# Altium project Zooid.PrjPcb
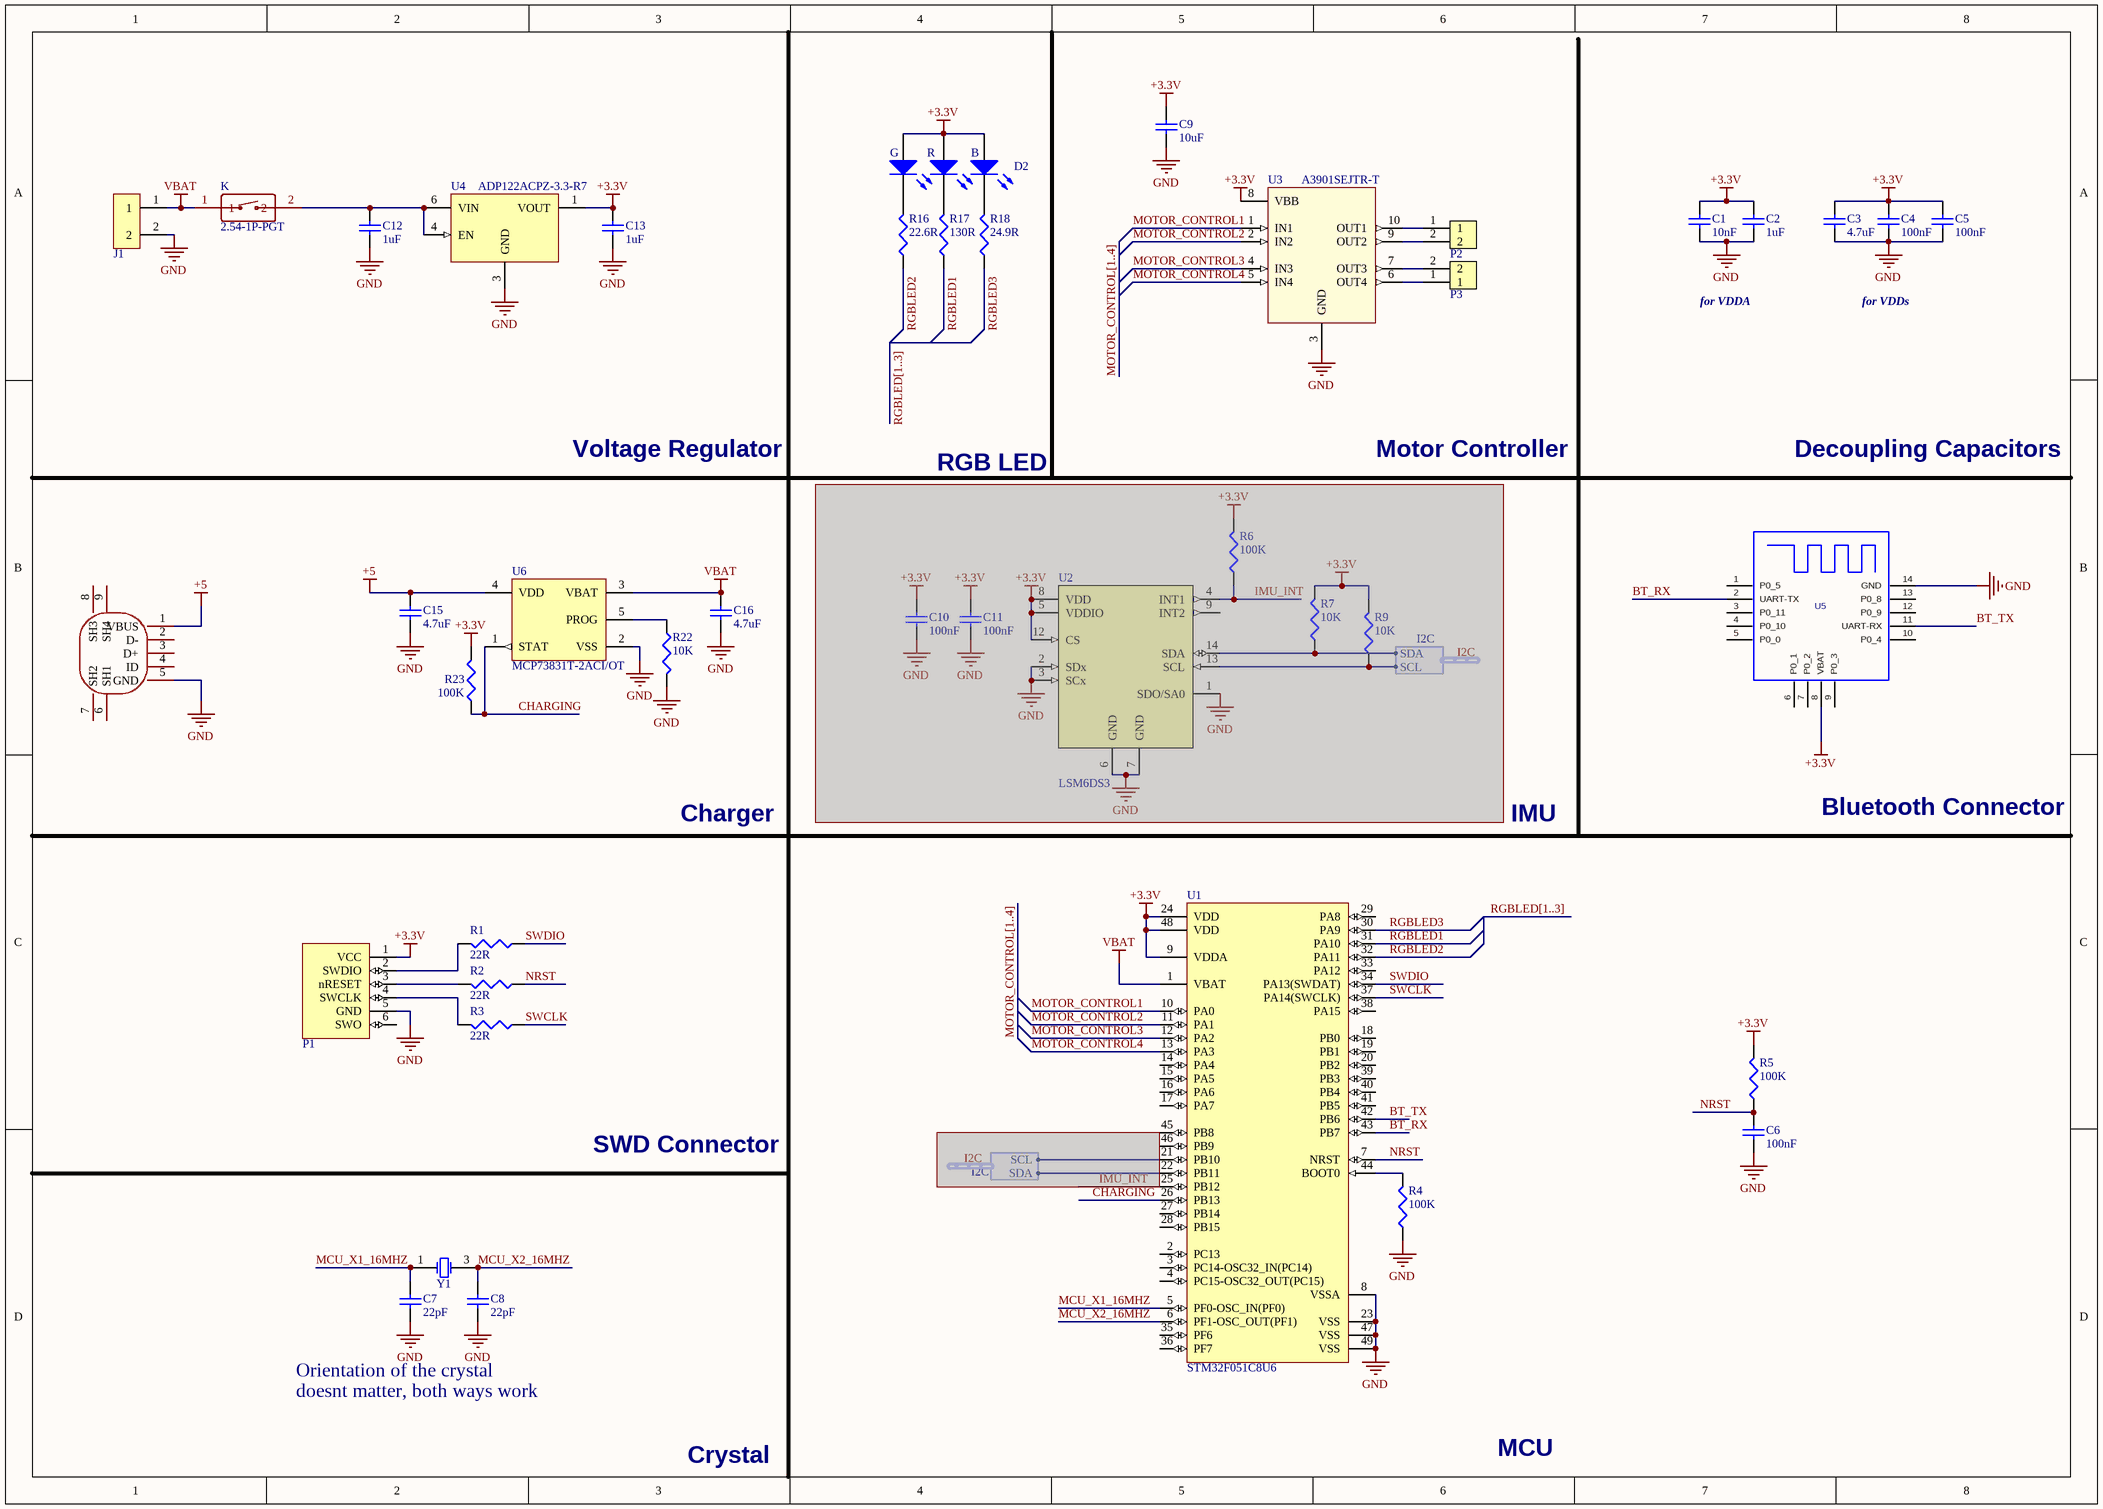
[diagram p0: ZooidMicrocontroller.SchDoc]
1 sheet, 42 parts. Net scope: global (net labels, ports and power ports of the same name join across sheets).
Board files: PCB1.PcbDoc, PCB2.PcbDoc, PCB3.PcbDoc

## Sheet ZooidMicrocontroller.SchDoc
size A3

### Parts
C1  10nF  [0402]
C2  1uF  [0603]
C3  4.7uF  [0603]
C4  100nF  [0402]
C5  100nF  [0402]
C6  100nF  [0402]
C7  22pF  [0402]
C8  22pF  [0402]
C9  10uF  [0603]
C10  100nF  [0402]  (masked out: inside a compile mask, not in the netlist)
C11  100nF  [0402]  (masked out: inside a compile mask, not in the netlist)
C12  1uF  [0603]
C13  1uF  [0603]
C15  4.7uF  [0603]
C16  4.7uF  [0603]
D2  SMLVN6RGB1W1  [3.5x2.8 mm 6-SMD]  (value not drawn)
J1  78171-0002  [HDR1*2]  (value not drawn)
K  2.54-1P-PGT  [SW-SMD_2P-L6.2-LS9.4]
P1  TC2030-IDC-NL  [TC2030-IDC-NL]  (value not drawn)
P2  HEADER 2X1 0.05" UNPOLARIZED  [HDR1*2]  (value not drawn)
P3  HEADER 2X1 0.05" UNPOLARIZED  [HDR1*2]  (value not drawn)
R1  22R  [0402]
R2  22R  [0402]
R3  22R  [0402]
R4  100K  [0402]
R5  100K  [0402]
R6  100K  [0402]  (masked out: inside a compile mask, not in the netlist)
R7  10K  [0402]  (masked out: inside a compile mask, not in the netlist)
R9  10K  [0402]  (masked out: inside a compile mask, not in the netlist)
R16  22.6R  [0402]
R17  130R  [0402]
R18  24.9R  [0402]
R22  10K  [0402]
R23  100K  [0402]
U1  STM32F051C8U6  [QFN50P700X700X60_HS-49L]
U2  LSM6DS3  [LGA-14 2.5x3x0.86 mm 14L]  (masked out: inside a compile mask, not in the netlist)
U3  A3901SEJTR-T  [DFN50P300X300X75_HS-11N]
U4  ADP122ACPZ-3.3-R7  [LFCSP-6 2.0X2.0X0.55]
U5  DX-BT24-T  [DX-BT24-T]  (value not drawn)
U6  MCP73831T-2ACI/OT  [SOT-23-OT5_L]
USB  MicroXNJ  [MICRO-USB-SMD_MICROXNJ]  (value not drawn)
Y1  7V-16.000MAAE-T  [3.2x2.5 CRYSTAL]  (value not drawn)

### Harnesses
I2C: SDA, SCL

### Nets
+3.3V: C1.2 C2.2 C3.2 C4.2 C5.2 C9.2 C13.2 D2.1(AB) D2.2(AR) D2.3(AG) P1.1(VCC) R5.2 R23.2 U1.9(VDDA) U1.24(VDD) U1.48(VDD) U3.8(VBB) U4.1(VOUT) U5.8(VBAT)
+5: C15.2 U6.4(VDD) USB.1(VBUS)
GND: C1.1 C2.1 C3.1 C4.1 C5.1 C6.1 C7.1 C8.1 C9.1 C12.1 C13.1 C15.1 C16.1 J1.2 P1.5(GND) R4.1 R22.2 U1.8(VSSA) U1.23(VSS) U1.47(VSS) U1.49(VSS) U3.3(GND) U3.11(PAD) U4.2(NC) U4.3(GND) U4.5(NC) U4.7(THPAD) U5.14(GND) U6.2(VSS) USB.5(GND) Y1.2(GND) Y1.4(GND)
VBAT: C16.2 J1.1 K.1 U1.1(VBAT) U6.3(VBAT)
BT_RX: U1.43(PB7) U5.2(UART-TX)
BT_TX: U1.42(PB6) U5.11(UART-RX)
CHARGING: R23.1 U1.26(PB13) U6.1(STAT)
MCU_X1_16MHZ: C7.2 U1.5(PF0-OSC_IN(PF0)) Y1.1(X1)
MCU_X2_16MHZ: C8.2 U1.6(PF1-OSC_OUT(PF1)) Y1.3(X2)
MOTOR_CONTROL1: U1.10(PA0) U3.1(IN1)
MOTOR_CONTROL2: U1.11(PA1) U3.2(IN2)
MOTOR_CONTROL3: U1.12(PA2) U3.4(IN3)
MOTOR_CONTROL4: U1.13(PA3) U3.5(IN4)
NRST: C6.2 R2.1 R5.1 U1.7(NRST)
RGBLED1: R17.1 U1.31(PA10)
RGBLED2: R16.1 U1.32(PA11)
RGBLED3: R18.1 U1.30(PA9)
SWCLK: R3.1 U1.37(PA14(SWCLK))
SWDIO: R1.1 U1.34(PA13(SWDAT))
NetC12_2: C12.2 K.2 U4.4(EN) U4.6(VIN)
NetD2_4: D2.4(KG) R16.2
NetD2_5: D2.5(KR) R17.2
NetD2_6: D2.6(KB) R18.2
NetP1_2: P1.2(SWDIO) R1.2
NetP1_3: P1.3(nRESET) R2.2
NetP1_4: P1.4(SWCLK) R3.2
NetP2_1: P2.1 U3.10(OUT1)
NetP2_2: P2.2 U3.9(OUT2)
NetP3_1: P3.1 U3.6(OUT4)
NetP3_2: P3.2 U3.7(OUT3)
NetR4_2: R4.2 U1.44(BOOT0)
NetR22_1: R22.1 U6.5(PROG)

Not connected (* = marked no-connect by the designer): P1 6(SWO); U1 2(PC13) 3(PC14-OSC32_IN(PC14)) 4(PC15-OSC32_OUT(PC15)) 14(PA4) 15(PA5) 16(PA6) 17(PA7) 18(PB0) 19(PB1) 20(PB2) 21(PB10) 22(PB11) 25(PB12) 27(PB14) 28(PB15) 29(PA8) 33(PA12) 35(PF6) 36(PF7) 38(PA15) 39(PB3) 40(PB4) 41(PB5) 45(PB8) 46(PB9); U5 1(P0_5) 3(P0_11) 4(P0_10) 5(P0_0) 6(P0_1) 7(P0_2) 9(P0_3) 10(P0_4) 12(P0_9) 13(P0_8); USB 2(D-) 3(D+) 4(ID) 6(SH1) 7(SH2) 8(SH3) 9(SH4)

### Buses and harness runs
bus MOTOR_CONTROL[1..4]
bus RGBLED[1..3]

### Notes on the sheet
- for VDDA
- for VDDs
- Voltage Regulator
- RGB LED
- Motor Controller
- Decoupling Capacitors
- Charger
- IMU
- Bluetooth Connector
- SWD Connector
- Orientation of the crystal
- doesnt matter, both ways work
- MCU
- Crystal
- (in symbol SMLVN6RGB1W1) G; R; B

### Library data of the parts
C1 = 10nF: 10nF 0402 X7R 25V ±5%; Supplier 1: Farnell; Supplier Part Number 1: 1692285; Supplier 2: Digi-Key; Supplier Part Number 2: 399-1279-1-ND; Value: 10nF
C2 C12 C13 = 1uF: 1uF 0603 X5R 10V ±10%; Supplier 1: Farnell; Supplier Part Number 1: 1759399; Supplier 2: Digi-Key; Supplier Part Number 2: 478-1251-1-ND; Value: 1uF
C3 C15 C16 = 4.7uF: 4.7uF 0603 X5R 10V ±10%; Supplier 1: Farnell; Supplier Part Number 1: 2362098; Supplier 2: Digi-Key; Supplier Part Number 2: 445-5170-1-ND; Value: 4.7uF
C4-C6 C10 C11 = 100nF: 100nF 0402 X7R 16V ±10%; Supplier 1: Farnell; Supplier Part Number 1: 1288252; Supplier 2: Digi-Key; Supplier Part Number 2: 399-3521-1-ND; Value: 100nF
C7 C8 = 22pF: 22pF 0402 NP0/CG0 50V ±5%; Supplier 1: Farnell; Supplier 2: Digi-Key; Supplier Part Number 1: 1414580; Supplier Part Number 2: 490-5868-1-ND; Value: 22pF
C9 = 10uF: 10uF 0603 X5R 6.3V ±20%; Supplier 1: Farnell; Supplier Part Number 1: 2456110; Supplier 2: Digi-Key; Supplier Part Number 2: 490-10475-1-ND; Value: 10uF
D2 = SMLVN6RGB1W1: ROHM SMLVN6RGB1W1 LED Tri-Color Blue/Green/Red Chip LED 6-Pin 1411 T/RLED Tri-Color Blue/Green/Red Chip LED 6-Pin 1411; Supplier 1: Mouser; Supplier 2: Digi-Key; Supplier Part Number 1: 755-SMLVN6RGB1W1; Supplier Part Number 2: 846-1187-1-ND
J1 = 78171-0002: Molex Pico-EZmate™ Wire-to-Board Header, 2 contacts; Supplier 1: Farnell; Supplier 2: Digi-Key; Supplier Part Number 1: 2313710; Supplier Part Number 2: WM4459CT-ND
P1 = TC2030-IDC-NL: TagConnect TC2030-IDC-NL SWD Programming Connector
R1-R3 = 22R: 22R 0402 1/16W ±1%; Supplier 1: Farnell; Supplier 2: Digi-Key; Supplier Part Number 1: 2072797; Supplier Part Number 2: 541-22.0LCT-ND; Value: 22R
R4-R6 R23 = 100K: 100K 0402 1/16W ±1%; Supplier 1: Farnell; Supplier Part Number 1: 2072519; Supplier 2: Digi-Key; Supplier Part Number 2: 541-100KLCT-ND; Value: 100K
R7 R9 R22 = 10K: 10K 0402 1/16W ±1%; Supplier 1: Farnell; Supplier Part Number 1: 2072517; Supplier 2: Digi-Key; Supplier Part Number 2: 541-10.0KLCT-ND; Value: 10K
R16 = 22.6R: 22.6R 0402 1/16W ±0.05R; Supplier 1: Farnell; Supplier 2: Digi-Key; Supplier Part Number 1: 2302454; Supplier Part Number 2: P22.6LCT-ND; Value: 22.6R
R17 = 130R: 130R 0402 1/16W ±0.05R; Supplier 1: Farnell; Supplier 2: Digi-Key; Supplier Part Number 1: 2059115; Supplier Part Number 2: P130LCT-ND; Value: 130R
R18 = 24.9R: 24.9R 0402 1/16W ±0.05R; Supplier 1: Farnell; Supplier 2: Digi-Key; Supplier Part Number 1: 2059102; Supplier Part Number 2: P24.9LCT-ND; Value: 24.9R
U1 = STM32F051C8U6: STMICROELECTRONICS  STM32F051C8U6  MCU 32BIT CORTEX-M0 48MHZ UFQFPN-48; Supplier 1: Farnell; Supplier 2: Digi-Key; Supplier Part Number 1: 2393638; Supplier Part Number 2: STM32F051C8U6-ND
U2 = LSM6DS3: STMicroelectronics iNEMO inertial module:   3D accelerometer and 3D gyroscope; Supplier 1: Farnell; Supplier Part Number 1: 2474253; Supplier 2: Digi-Key; Supplier Part Number 2: 497-15383-1-ND
U3 = A3901SEJTR-T: ALLEGRO MICROSYSTEMS - A3901SEJTR-T - IC, MOTOR DRIVER; Supplier 1: Farnell; Supplier 2: Digi-Key; Supplier Part Number 1: 1651947; Supplier Part Number 2: 620-1159-1-ND
U4 = ADP122ACPZ-3.3-R7: Analog Devices ADP122ACPZ-3.3-R7 - 5.5 V Input, 300 mA, Low Quiescent  Current, CMOS Linear Regulator; Supplier 1: Farnell; Supplier 2: Digi-Key; Supplier Part Number 1: 2457164; Supplier Part Number 2: ADP122ACPZ-3.3-R7CT-ND
U5 = DX-BT24-T: PCB DECAL: DX-BT24-S
U6 = MCP73831T-2ACI/OT: Miniature Single-Cell, Fully Integrated Li-Ion, Li-Polymer Charge Management Controller, 4.2V, 5-Pin SOT-23, Industrial Temperature, Tape and Reel; Published: 29-Jan-2009; LatestRevisionDate: 27-Nov-2009; LatestRevisionNote: Updated to datasheet revision E, Sep-2008; DatasheetVersion: revE, Sep-2008; PackageVersion: revBB, Aug-2009; PackageReference: SOT-23-OT5; Publisher: Altium Limited; PackageDescription: 5-Lead Plastic Small Outline Transistor (OT) [SOT-23]; Supplier 1: Farnell; Supplier Part Number 1: 1332158; Code_IPC: SOT23-5; ComponentLink1Description: Datasheet; ComponentLink1URL: http://ww1.microchip.com/downloads/en/DeviceDoc/21984e.pdf; ComponentLink2Description: Packaging Specification; ComponentLink2URL: http://www.microchip.com/stellent/groups/techpub_sg/documents/packagingspec/en012702.pdf; ComponentLink3Description: Microchip.com Home; ComponentLink3URL: http://www.microchip.com/
USB = MicroXNJ: Manufacturer: SHOU HAN(首韩); Add into BOM: yes; Connector Type: Micro-B; Gender: 母; Number of Contacts: 5P; Number of Ports: 1; Current Rating - Power (Max): 1.8A; Rated Voltage (Max): 30V; Connect-Disconnect Life: 5千次; Core Colour: 黑色; Symbol: MICROXNJ; Device: MicroXNJ; LCSC Part Name: Micro-B 母 卧贴; Supplier Part: C404969; Manufacturer Part: MicroXNJ; Supplier Footprint: SMD; JLCPCB Part Class: Extended Part; Datasheet: https://atta.szlcsc.com/upload/public/pdf/source/20220415/2494EDFF499AF6F852F7C820374B6AF3.pdf; Supplier: LCSC; Convert to PCB: yes; Standard: USB 2.0; Mounting Style: 卧贴; Operating Temperature Range: -20℃~+85℃
Y1 = 7V-16.000MAAE-T: TXC - 7V-16.000MAAE-T, 16MHZ, 30PPM, 12PF - CRYSTAL; Supplier 1: Digi-Key; Supplier 2: Farnell; Supplier Part Number 1: 887-1462-1-ND; Supplier Part Number 2: 1892172